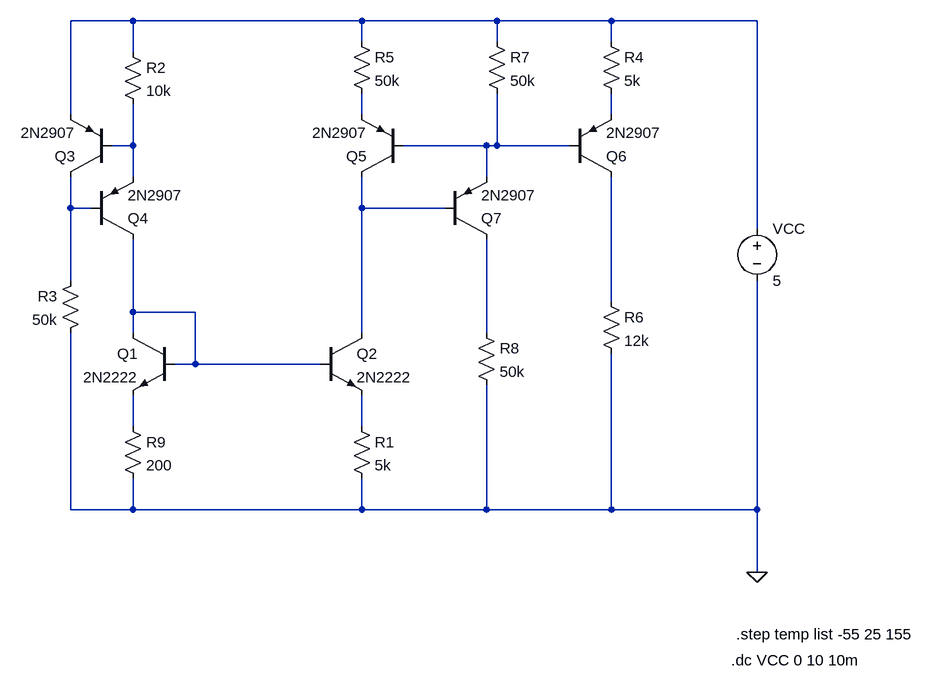
[diagram p0: schematic Widlar_Current_Source.asc]
Widlar_Current_Source.asc, the LTspice schematic file:
Version 4.1
SHEET 1 2072 1024
WIRE -64 -352 -160 -352
WIRE 288 -352 -64 -352
WIRE 496 -352 288 -352
WIRE 672 -352 496 -352
WIRE 896 -352 672 -352
WIRE 288 -320 288 -352
WIRE 496 -320 496 -352
WIRE 672 -320 672 -352
WIRE -64 -304 -64 -352
WIRE -160 -208 -160 -352
WIRE 288 -208 288 -240
WIRE 672 -208 672 -240
WIRE -64 -160 -64 -224
WIRE -64 -160 -96 -160
WIRE 480 -160 352 -160
WIRE 496 -160 496 -240
WIRE 496 -160 480 -160
WIRE 608 -160 496 -160
WIRE -64 -112 -64 -160
WIRE 480 -112 480 -160
WIRE -160 -64 -160 -112
WIRE -128 -64 -160 -64
WIRE 288 -64 288 -112
WIRE 416 -64 288 -64
WIRE 896 -32 896 -352
WIRE -160 48 -160 -64
WIRE 672 80 672 -112
WIRE -64 96 -64 -16
WIRE 32 96 -64 96
WIRE -64 128 -64 96
WIRE 288 128 288 -64
WIRE 480 128 480 -16
WIRE 32 176 32 96
WIRE 32 176 0 176
WIRE 224 176 32 176
WIRE -64 272 -64 224
WIRE 288 272 288 224
WIRE -160 400 -160 128
WIRE -64 400 -64 352
WIRE -64 400 -160 400
WIRE 288 400 288 352
WIRE 288 400 -64 400
WIRE 480 400 480 208
WIRE 480 400 288 400
WIRE 672 400 672 160
WIRE 672 400 480 400
WIRE 896 400 896 48
WIRE 896 400 672 400
WIRE 896 496 896 400
FLAG 896 496 0
SYMBOL npn 0 128 M0
SYMATTR InstName Q1
SYMATTR Value 2N2222
SYMBOL npn 224 128 R0
SYMATTR InstName Q2
SYMATTR Value 2N2222
SYMBOL voltage 896 -48 R0
WINDOW 123 0 0 Left 0
WINDOW 39 0 0 Left 0
SYMATTR InstName VCC
SYMATTR Value 5
SYMBOL res 272 256 R0
SYMATTR InstName R1
SYMATTR Value 5k
SYMBOL res -80 -320 R0
SYMATTR InstName R2
SYMATTR Value 10k
SYMBOL pnp -96 -112 R180
SYMATTR InstName Q3
SYMATTR Value 2N2907
SYMBOL pnp -128 -16 M180
SYMATTR InstName Q4
SYMATTR Value 2N2907
SYMBOL res -144 32 M0
SYMATTR InstName R3
SYMATTR Value 50k
SYMBOL res 272 -336 R0
SYMATTR InstName R5
SYMATTR Value 50k
SYMBOL pnp 352 -112 R180
SYMATTR InstName Q5
SYMATTR Value 2N2907
SYMBOL res 656 -336 R0
SYMATTR InstName R4
SYMATTR Value 5k
SYMBOL pnp 608 -112 M180
SYMATTR InstName Q6
SYMATTR Value 2N2907
SYMBOL res 656 64 R0
SYMATTR InstName R6
SYMATTR Value 12k
SYMBOL pnp 416 -16 M180
SYMATTR InstName Q7
SYMATTR Value 2N2907
SYMBOL res 480 -336 R0
SYMATTR InstName R7
SYMATTR Value 50k
SYMBOL res 464 112 R0
SYMATTR InstName R8
SYMATTR Value 50k
SYMBOL res -80 256 R0
SYMATTR InstName R9
SYMATTR Value 200
TEXT 856 632 Left 2 !.dc VCC 0 10 10m
TEXT 864 592 Left 2 !.step temp list -55 25 155

The netlist it stands for:
* Widlar_Current_Source.asc
Q1 N009 N009 N011 0 2N2222
Q2 N007 N009 N012 0 2N2222
VCC N001 0 5
R1 N012 0 5k
R2 N001 N004 10k
Q3 N006 N004 N001 0 2N2907
Q4 N009 N006 N004 0 2N2907
R3 N006 0 50k
R5 N001 N002 50k
Q5 N007 N005 N002 0 2N2907
R4 N001 N003 5k
Q6 N008 N005 N003 0 2N2907
R6 N008 0 12k
Q7 N010 N007 N005 0 2N2907
R7 N001 N005 50k
R8 N010 0 50k
R9 N011 0 200
.model NPN NPN
.model PNP PNP
.lib standard.bjt
.dc VCC 0 10 10m
.step temp list -55 25 155
.backanno
.end